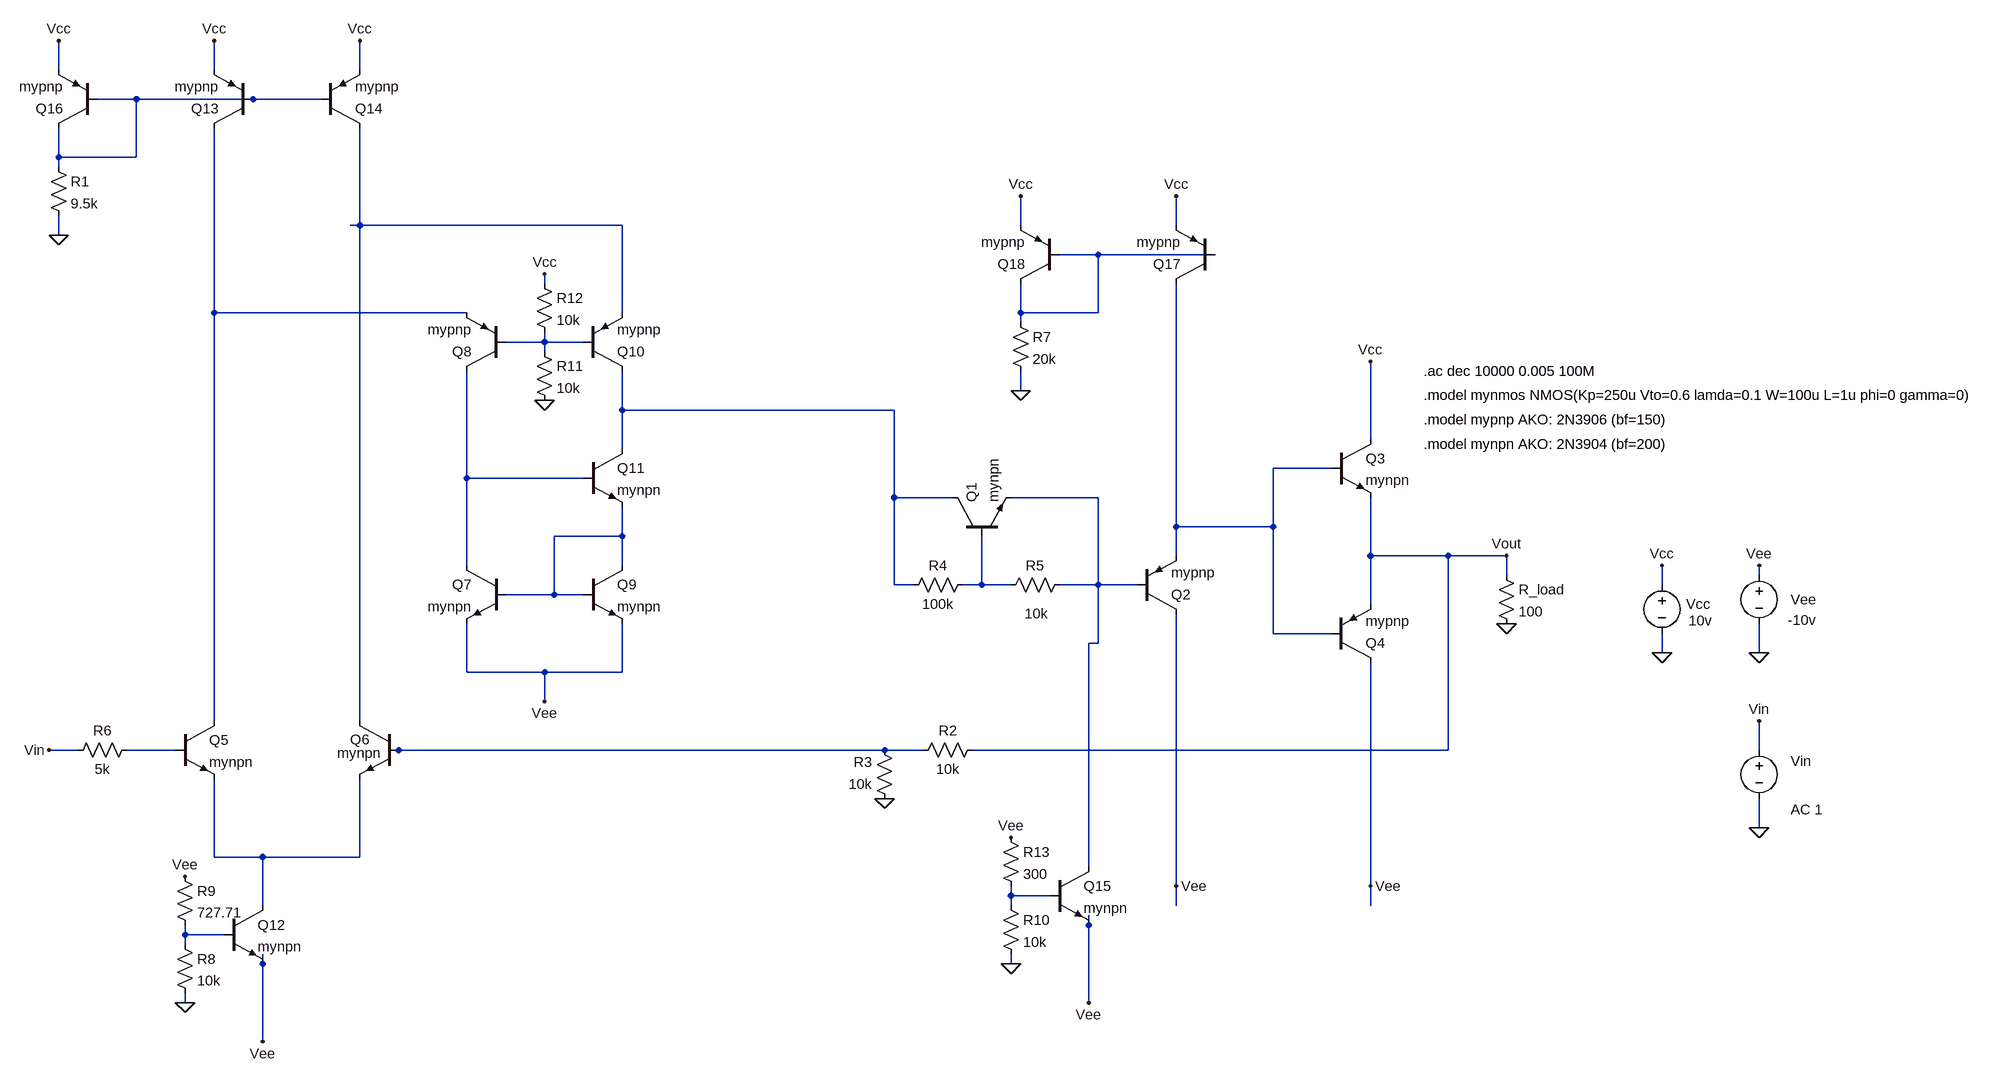
[diagram p0: schematic design2.asc]
design2.asc, the LTspice schematic file:
Version 4
SHEET 1 2852 1884
WIRE -736 -752 -736 -800
WIRE -480 -752 -480 -800
WIRE -240 -752 -240 -800
WIRE -608 -704 -672 -704
WIRE -416 -704 -608 -704
WIRE -304 -704 -416 -704
WIRE -736 -608 -736 -656
WIRE -608 -608 -608 -704
WIRE -608 -608 -736 -608
WIRE -736 -592 -736 -608
WIRE -240 -496 -240 -656
WIRE -240 -496 -256 -496
WIRE 192 -496 -240 -496
WIRE 848 -496 848 -544
WIRE 1104 -496 1104 -544
WIRE -736 -480 -736 -512
WIRE 976 -448 912 -448
WIRE 1168 -448 976 -448
WIRE 64 -400 64 -416
WIRE -480 -352 -480 -656
WIRE -64 -352 -480 -352
WIRE 192 -352 192 -496
WIRE 848 -352 848 -400
WIRE 976 -352 976 -448
WIRE 976 -352 848 -352
WIRE 848 -336 848 -352
WIRE 64 -304 64 -320
WIRE 64 -304 0 -304
WIRE 128 -304 64 -304
WIRE 64 -288 64 -304
WIRE 848 -224 848 -256
WIRE 192 -192 192 -256
WIRE 640 -192 192 -192
WIRE 1424 -144 1424 -272
WIRE 192 -128 192 -192
WIRE 1360 -96 1264 -96
WIRE -64 -80 -64 -256
WIRE 128 -80 -64 -80
WIRE 640 -48 640 -192
WIRE 736 -48 640 -48
WIRE 976 -48 832 -48
WIRE 1104 0 1104 -400
WIRE 1264 0 1264 -96
WIRE 1264 0 1104 0
WIRE 192 16 192 -32
WIRE 192 16 80 16
WIRE 1104 48 1104 0
WIRE 1424 48 1424 -48
WIRE 1552 48 1424 48
WIRE 1648 48 1552 48
WIRE -64 64 -64 -80
WIRE 192 64 192 16
WIRE 1648 80 1648 48
WIRE 2064 80 2064 64
WIRE 640 96 640 -48
WIRE 672 96 640 96
WIRE 784 96 784 16
WIRE 784 96 752 96
WIRE 832 96 784 96
WIRE 976 96 976 -48
WIRE 976 96 912 96
WIRE 1040 96 976 96
WIRE 1904 96 1904 64
WIRE 80 112 80 16
WIRE 80 112 0 112
WIRE 128 112 80 112
WIRE 1424 128 1424 48
WIRE 1264 176 1264 0
WIRE 1360 176 1264 176
WIRE 976 192 976 96
WIRE 976 192 960 192
WIRE 1904 208 1904 176
WIRE 2064 208 2064 160
WIRE -64 240 -64 160
WIRE 64 240 -64 240
WIRE 192 240 192 160
WIRE 192 240 64 240
WIRE 64 288 64 240
WIRE -480 320 -480 -352
WIRE -240 320 -240 -496
WIRE -704 368 -752 368
WIRE -544 368 -624 368
WIRE -176 368 -192 368
WIRE 624 368 -176 368
WIRE 688 368 624 368
WIRE 1552 368 1552 48
WIRE 1552 368 768 368
WIRE 2064 368 2064 320
WIRE 2064 496 2064 448
WIRE -480 544 -480 416
WIRE -400 544 -480 544
WIRE -240 544 -240 416
WIRE -240 544 -400 544
WIRE 960 560 960 192
WIRE 1104 592 1104 144
WIRE 1424 592 1424 224
WIRE 832 608 832 592
WIRE 896 608 832 608
WIRE -400 624 -400 544
WIRE 832 624 832 608
WIRE 1104 624 1104 592
WIRE 1424 624 1424 592
WIRE 960 656 960 640
WIRE -528 672 -528 656
WIRE -464 672 -528 672
WIRE -528 688 -528 672
WIRE -400 720 -400 704
WIRE 832 720 832 704
WIRE -528 784 -528 768
WIRE 960 784 960 656
WIRE -400 848 -400 720
FLAG 1648 160 0
FLAG 1904 208 0
FLAG 2064 208 0
FLAG 1904 64 Vcc
FLAG 2064 64 Vee
FLAG 624 448 0
FLAG 1104 592 Vee
FLAG 1648 48 Vout
FLAG 2064 496 0
FLAG 2064 320 Vin
FLAG 1424 -272 Vcc
FLAG 1424 592 Vee
FLAG -400 848 Vee
FLAG -752 368 Vin
FLAG -480 -800 Vcc
FLAG 64 288 Vee
FLAG 64 -208 0
FLAG 64 -416 Vcc
FLAG -528 784 0
FLAG -528 576 Vee
FLAG -240 -800 Vcc
FLAG 960 784 Vee
FLAG 832 720 0
FLAG 832 512 Vee
FLAG -736 -800 Vcc
FLAG -736 -480 0
FLAG 1104 -544 Vcc
FLAG 848 -544 Vcc
FLAG 848 -224 0
SYMBOL res 640 464 R180
WINDOW 0 36 76 Left 2
WINDOW 3 36 40 Left 2
SYMATTR InstName R3
SYMATTR Value 10k
SYMBOL npn 736 16 R270
SYMATTR InstName Q1
SYMATTR Value mynpn
SYMBOL res 768 80 R90
WINDOW 0 0 56 VBottom 2
WINDOW 3 32 56 VTop 2
SYMATTR InstName R4
SYMATTR Value 100k
SYMBOL res 928 80 R90
WINDOW 0 0 56 VBottom 2
WINDOW 3 48 54 VTop 2
SYMATTR InstName R5
SYMATTR Value 10k
SYMBOL pnp 1040 144 M180
SYMATTR InstName Q2
SYMATTR Value mypnp
SYMBOL npn 1360 -144 R0
SYMATTR InstName Q3
SYMATTR Value mynpn
SYMBOL pnp 1360 224 M180
SYMATTR InstName Q4
SYMATTR Value mypnp
SYMBOL res 1632 64 R0
SYMATTR InstName R_load
SYMATTR Value 100
SYMBOL voltage 1904 80 R0
WINDOW 123 0 0 Left 0
WINDOW 39 0 0 Left 0
WINDOW 0 40 48 Left 2
WINDOW 3 44 75 Left 2
SYMATTR InstName Vcc
SYMATTR Value 10v
SYMBOL voltage 2064 64 R0
WINDOW 123 0 0 Left 0
WINDOW 39 0 0 Left 0
WINDOW 0 52 56 Left 2
WINDOW 3 47 90 Left 2
SYMATTR InstName Vee
SYMATTR Value -10v
SYMBOL voltage 2064 352 R0
WINDOW 123 52 114 Left 2
WINDOW 39 0 0 Left 0
WINDOW 3 51 74 Left 2
WINDOW 0 52 34 Left 2
SYMATTR Value2 AC 1
SYMATTR Value ""
SYMATTR InstName Vin
SYMBOL res 784 352 R90
WINDOW 0 0 56 VBottom 2
WINDOW 3 32 56 VTop 2
SYMATTR InstName R2
SYMATTR Value 10k
SYMBOL res -608 352 R90
WINDOW 0 0 56 VBottom 2
WINDOW 3 32 56 VTop 2
SYMATTR InstName R6
SYMATTR Value 5k
SYMBOL npn -544 320 R0
SYMATTR InstName Q5
SYMATTR Value mynpn
SYMBOL npn -176 320 M0
WINDOW 3 29 53 Left 2
WINDOW 0 48 31 Left 2
SYMATTR Value mynpn
SYMATTR InstName Q6
SYMBOL npn 0 64 M0
SYMATTR InstName Q7
SYMATTR Value mynpn
SYMBOL npn 128 64 R0
SYMATTR InstName Q9
SYMATTR Value mynpn
SYMBOL pnp 128 -256 M180
SYMATTR InstName Q10
SYMATTR Value mypnp
SYMBOL pnp 0 -256 R180
SYMATTR InstName Q8
SYMATTR Value mypnp
SYMBOL npn 128 -128 R0
SYMATTR InstName Q11
SYMATTR Value mynpn
SYMBOL pnp -304 -656 M180
SYMATTR InstName Q14
SYMATTR Value mypnp
SYMBOL pnp -416 -656 R180
SYMATTR InstName Q13
SYMATTR Value mypnp
SYMBOL res 48 -304 R0
SYMATTR InstName R11
SYMATTR Value 10k
SYMBOL res 48 -416 R0
SYMATTR InstName R12
SYMATTR Value 10k
SYMBOL npn -464 624 R0
SYMATTR InstName Q12
SYMATTR Value mynpn
SYMBOL res -544 672 R0
SYMATTR InstName R8
SYMATTR Value 10k
SYMBOL res -544 560 R0
SYMATTR InstName R9
SYMATTR Value 727.71
SYMBOL npn 896 560 R0
SYMATTR InstName Q15
SYMATTR Value mynpn
SYMBOL res 816 608 R0
SYMATTR InstName R10
SYMATTR Value 10k
SYMBOL res 816 496 R0
SYMATTR InstName R13
SYMATTR Value 300
SYMBOL pnp -672 -656 R180
SYMATTR InstName Q16
SYMATTR Value mypnp
SYMBOL res -752 -608 R0
SYMATTR InstName R1
SYMATTR Value 9.5k
SYMBOL pnp 1168 -400 R180
SYMATTR InstName Q17
SYMATTR Value mypnp
SYMBOL pnp 912 -400 R180
SYMATTR InstName Q18
SYMATTR Value mypnp
SYMBOL res 832 -352 R0
SYMATTR InstName R7
SYMATTR Value 20k
TEXT 1512 -176 Left 2 !.model mypnp AKO: 2N3906 (bf=150)
TEXT 1512 -136 Left 2 !.model mynpn AKO: 2N3904 (bf=200)
TEXT 1512 -216 Left 2 !.model mynmos NMOS(Kp=250u Vto=0.6 lamda=0.1 W=100u L=1u phi=0 gamma=0)
TEXT 1512 -256 Left 2 !.ac dec 10000 0.005 100M

The netlist it stands for:
* design2.asc
R3 0 N013 10k
Q1 N006 N011 N009 0 mynpn
R4 N011 N006 100k
R5 N009 N011 10k
Q2 Vee N009 N007 0 mypnp
Q3 Vcc N007 Vout 0 mynpn
Q4 Vee N007 Vout 0 mypnp
R_load Vout 0 100
Vcc Vcc 0 10v
Vee Vee 0 -10v
Vin Vin 0 AC 1
R2 Vout N013 10k
R6 N012 Vin 5k
Q5 N004 N012 N014 0 mynpn
Q6 N002 N013 N014 0 mynpn
Q7 N008 N010 Vee 0 mynpn
Q9 N010 N010 Vee 0 mynpn
Q10 N006 N005 N002 0 mypnp
Q8 N008 N005 N004 0 mypnp
Q11 N006 N008 N010 0 mynpn
Q14 N002 N001 Vcc 0 mypnp
Q13 N004 N001 Vcc 0 mypnp
R11 N005 0 10k
R12 Vcc N005 10k
Q12 N014 N016 Vee 0 mynpn
R8 N016 0 10k
R9 Vee N016 727.71
Q15 N009 N015 Vee 0 mynpn
R10 N015 0 10k
R13 Vee N015 300
Q16 N001 N001 Vcc 0 mypnp
R1 N001 0 9.5k
Q17 N007 N003 Vcc 0 mypnp
Q18 N003 N003 Vcc 0 mypnp
R7 N003 0 20k
.model NPN NPN
.model PNP PNP
.lib standard.bjt
.model mypnp AKO: 2N3906 (bf=150)
.model mynpn AKO: 2N3904 (bf=200)
.model mynmos NMOS(Kp=250u Vto=0.6 lamda=0.1 W=100u L=1u phi=0 gamma=0)
.ac dec 10000 0.005 100M
.backanno
.end